# Altium schematic sheet Peripherals.SchDoc
size A4; SheetNumber: 3; SheetTotal: 3
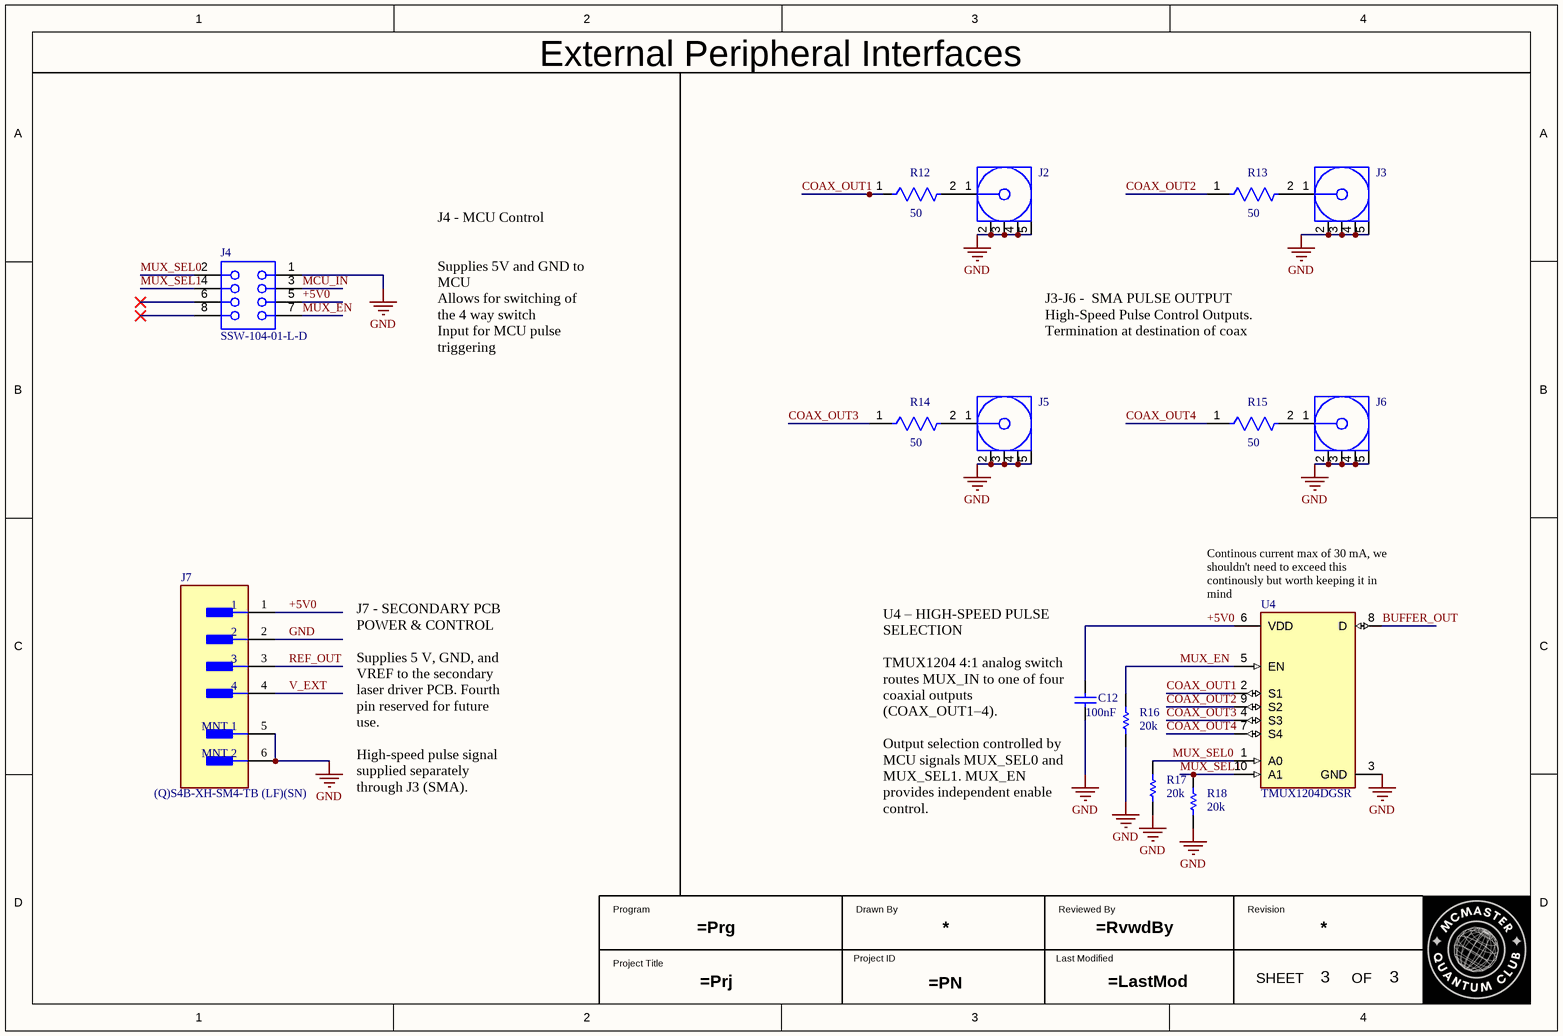
[diagram p0: Peripherals.SchDoc]

## Parts
C12  100nF  [CAPC2013X145X50LL20T20]
J2  60312242114510  [60312242114510]  (value not drawn)
J3  60312242114510  [60312242114510]  (value not drawn)
J4  SSW-104-01-L-D  [SMTC-SSW-104-01-X-D]
J5  60312242114510  [60312242114510]  (value not drawn)
J6  60312242114510  [60312242114510]  (value not drawn)
J7  (Q)S4B-XH-SM4-TB (LF)(SN)  [FP-Q_S4B-XH-SM4-TB_LF-MFG]
R12  50  [FP-CRCW0603-e3-MFG]
R13  50  [FP-CRCW0603-e3-MFG]
R14  50  [FP-CRCW0603-e3-MFG]
R15  50  [FP-CRCW0603-e3-MFG]
R16  20k  [RESC3116X65X40ML10T20]
R17  20k  [RESC3116X65X40ML10T20]
R18  20k  [RESC3116X65X40ML10T20]
U4  TMUX1204DGSR  [FP-DGS0010A-MFG]

## Nets
GND: C12.2 J2.2(GND) J2.3(GND) J2.4(GND) J2.5(GND) J3.2(GND) J3.3(GND) J3.4(GND) J3.5(GND) J4.1 J5.2(GND) J5.3(GND) J5.4(GND) J5.5(GND) J6.2(GND) J6.3(GND) J6.4(GND) J6.5(GND) J7.2 J7.5(MNT_1) J7.6(MNT_2) R16.1 R17.1 R18.1 U4.3(GND)
+5V0: C12.1 J4.5 J7.1 U4.6(VDD)
BUFFER_OUT: U4.8(D)
COAX_OUT1: R12.1 U4.2(S1)
COAX_OUT2: R13.1 U4.9(S2)
COAX_OUT3: R14.1 U4.4(S3)
COAX_OUT4: R15.1 U4.7(S4)
MCU_IN: J4.3
MUX_EN: J4.7 R16.2 U4.5(EN)
MUX_SEL0: J4.2 R17.2 U4.1(A0)
MUX_SEL1: J4.4 R18.2 U4.10(A1)
REF_OUT: J7.3
V_EXT: J7.4
NetJ2_1: J2.1(Signal) R12.2
NetJ3_1: J3.1(Signal) R13.2
NetJ5_1: J5.1(Signal) R14.2
NetJ6_1: J6.1(Signal) R15.2

Not connected (* = marked no-connect by the designer): J4 6* 8*

## Notes on the sheet
- External Peripheral Interfaces
- Type @ to refer to a designator
- J3-J6 -  SMA PULSE OUTPUT
  High-Speed Pulse Control Outputs.
  Termination at destination of coax
- J4 - MCU Control
  Supplies 5V and GND to MCU
  Allows for switching of the 4 way switch
  Input for MCU pulse triggering
- (near U4) Continous current max of 30 mA, we shouldn't need to exceed this continously but worth keeping it in mind
- J7 - SECONDARY PCB POWER & CONTROL
  Supplies 5 V, GND, and VREF to the secondary laser driver PCB. Fourth pin reserved for future use.
  High-speed pulse signal supplied separately through J3 (SMA).
- (near C12) U4 – HIGH-SPEED PULSE SELECTION
  TMUX1204 4:1 analog switch routes MUX_IN to one of four coaxial outputs (COAX_OUT1–4).
  Output selection controlled by MCU signals MUX_SEL0 and MUX_SEL1. MUX_EN provides independent enable control.
- Program
- Drawn By
- Reviewed By
- Revision
- Project Title
- Project ID
- Last Modified
- SHEET
- OF

## Library data of the parts
C12 = CMP-2007-01396-1: Part Number: VJ0805Y104JXXPW1BC; Manufacturer: Vitramon
J2 J3 J5 J6 = CMP-03913-97004434-3: Rf Coax Conn, Sma Jack, 50 Ohm, Pcb Rohs Compliant: Yes; Insertion Loss (dB): 0.14dB; Impedance: 50Ω; Insulation Resistance: 5GΩ; Orientation: Straight; Connector Type: SMA; Max Operating Temperature: 165°C; Insulation Material: PTFE; Min Operating Temperature: -65°C
J4 = CMP-1023-00337-1: SQ Post Socket, Through-hole, Vertical, -55 to 125 degC, 2.54mm Pitch, 8-Pin, Female, RoHS; Manufacturer: Samtec; ComponentLink3URL: http://www.samtec.com/documents/webfiles/cpdf/SSW-1XX-XX-XXX-X-XX-XXX-XX-MKT.pdf; Orientation: Vertical; ComponentLink2Description: Datasheet; Temperature Range: -55 to 125 degC; PackageDescription: Assembly, Socket Strip .016 X .031 Tail; RoHS: True; ComponentLink1Description: Manufacturer URL; ComponentLink2URL: http://www.samtec.com/documents/webfiles/pdf/SSW_TH.PDF; ComponentLink1URL: http://www.samtec.com; PartNumber: SSW-104-01-L-D; DatasheetVersion: F-214; Pitch: 2.54 mm; ComponentLink3Description: Package Specification; PackageReference: SSW-104-01-X-D; PackageVersion: CA, 6/1987; Mounting Technology: Through-hole
J7 = CMP-17439-000477-1: CONN HEADER SMD R/A 4POS 2.5MM
R12-R15 = CMP-2000-03436-2: RES Thick Film, 50Ω, 1%, 0.1W, 100ppm/°C, 0603; Voltage Rating (DC): 75V; Resistance: 50R; Power Rating: 100mW; Case/Package: 0603; Packaging: Tape and Reel; Military Standard: Not; REACH SVHC: No SVHC; Width: 0.85mm; Max Operating Temperature: 155°C; Case Code (Metric): 1608; Temperature Coefficient: 100ppm/°C; Lead Free: Lead Free; Height: 0.45mm; Composition: Thick Film; Termination: SMD/SMT; Contact Plating: Tin; Number of Pins: 2; Tolerance: 1%; Depth: 0.85mm; Weight: 7.1E-05oz; Min Operating Temperature: -55°C; Length: 1.55mm; Radiation Hardening: No; Voltage Rating: 75V; Case Code (Imperial): 0603; Package Quantity: 5000; Mount: Surface Mount
R16-R18 = CMP-2003-04939-1: Part Number: RC1206FR-1320KL; Manufacturer: Yageo
U4 = CMP-04892-000013-1: MULTIPLEXER; Manufacturer: Texas Instruments; Max Junction Temp: +150°C; Mux Demux Ratio: 4:1; Nominal Supply Current: 0.01uA; Max Supply Voltage: 5.5V; Standoff Height: 0.05mm; Number Of Circuits: 1; Min Supply Voltage: 1.08V; On State Resistance: 5Ω; Throw Configuration: SP4T; -3Db Bandwith: 125MHz; Device Class L1: Integrated Circuits (ICs); Package: DGS0010A; Category: IC; Device Class L3: Multiplexers; Temperature Range Low: -40°C; Automotive: No; Mouser Description: 5-V 4: 1 general-purpose analog multiplexer 10-VSSOP -40 to 125; Lead Free: Yes; Octopart: https://octopart.com/tmux1204dgsr-texas+instruments-101015770; Temperature Range High: +125°C; Ambient Temperature Range Low: -40°C; ComponentLink2URL: http://www.ti.com/lit/ds/symlink/tmux1204.pdf; Ambient Temperature Range High: +125°C; ComponentLink2Description: Datasheet; Height: 1.1mm; Device Class L2: Interface ICs; RoHS: TRUE; Digikey Description: MULTIPLEXER; Temperature: -40°C to +125°C; Manufacturer Part Number: TMUX1204DGSR